# Altium schematic sheet 00_main.SchDoc: Portable_Guitar_MultiFX
size A4; Author: Javier Estiven Leon Calderon; Organization: Altium Limited; Address1: L3, 12a Rodborough Rd; Address2: Frenchs Forest; Address3: NSW; Address4: Australia 2086; DocumentNumber: 1; Revision: 1.0; SheetNumber: 1; SheetTotal: 5
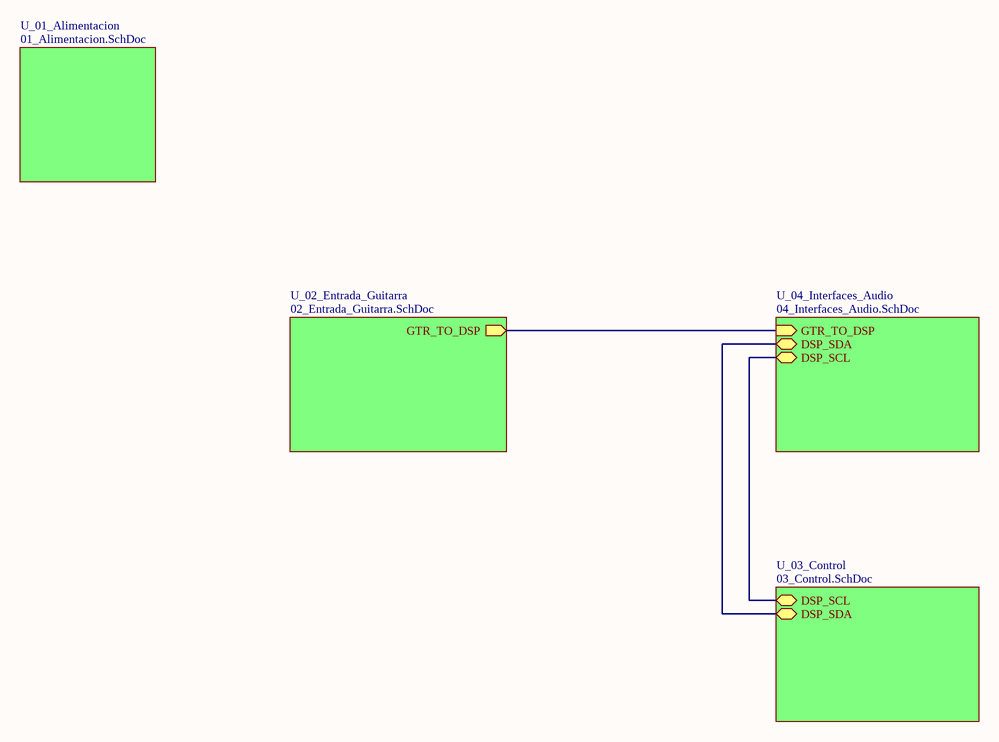
[diagram p0: 00_main.SchDoc]

## Sub-sheets
U_01_Alimentacion = 01_Alimentacion.SchDoc: no entries
U_02_Entrada_Guitarra = 02_Entrada_Guitarra.SchDoc: GTR_TO_DSP (out)
U_03_Control = 03_Control.SchDoc: DSP_SCL (bidir), DSP_SDA (bidir)
U_04_Interfaces_Audio = 04_Interfaces_Audio.SchDoc: GTR_TO_DSP (in), DSP_SDA (bidir), DSP_SCL (bidir)

## Nets
(unnamed): sheet U_02_Entrada_Guitarra/GTR_TO_DSP, sheet U_04_Interfaces_Audio/GTR_TO_DSP
(unnamed): sheet U_04_Interfaces_Audio/DSP_SDA, sheet U_03_Control/DSP_SDA
(unnamed): sheet U_04_Interfaces_Audio/DSP_SCL, sheet U_03_Control/DSP_SCL

## Notes on the sheet
- Title
- Size:
- Date:
- A4
- Number:
- Time:
- Revision:
- Sheet
- of
- File: